# EAGLE design source_eagle (EAGLE 9.6.2)
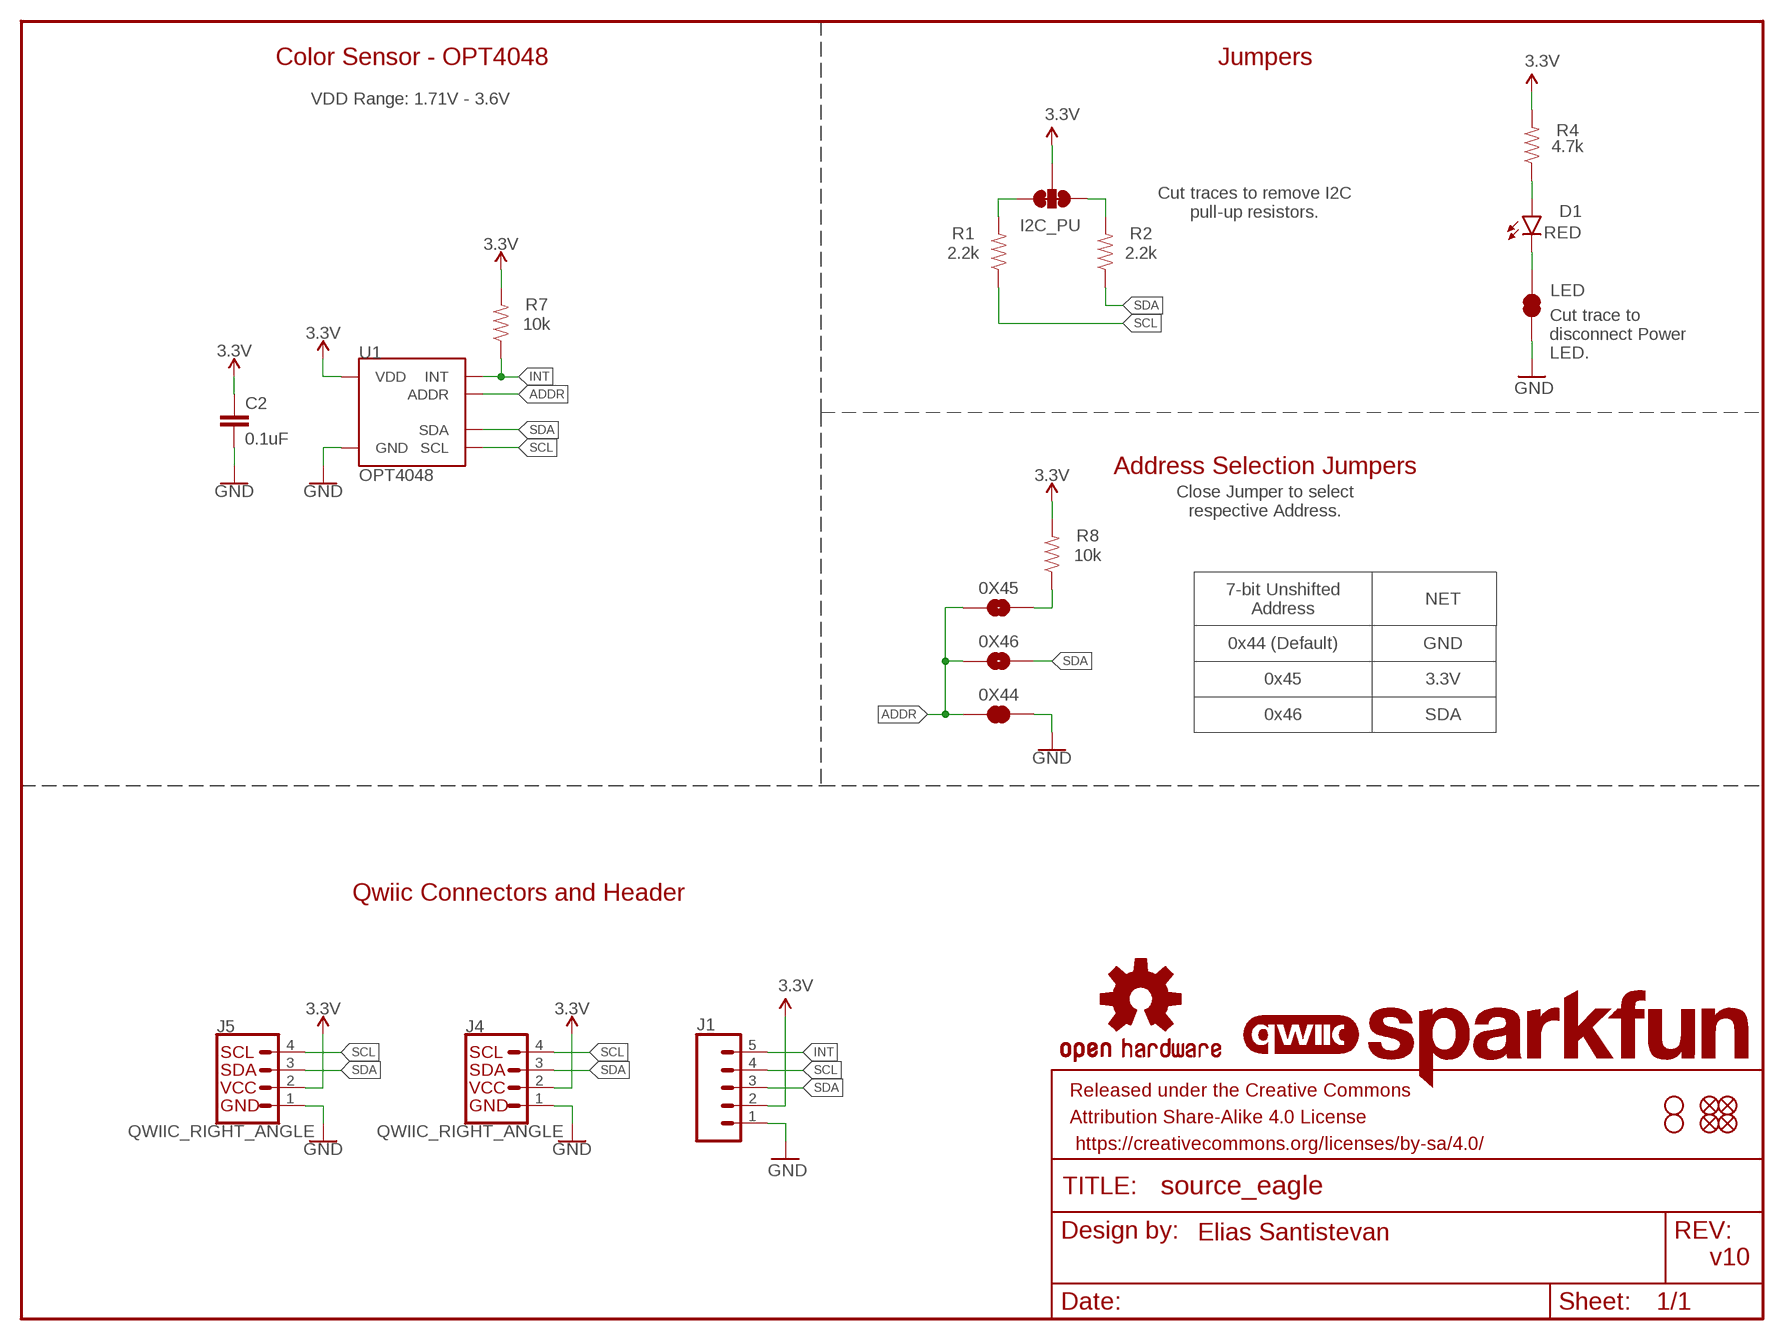
[diagram p0: schematic, sheet 1]

## Parts
0X44  JUMPER-SMT_2_NC_TRACE_SILK  [SMT-JUMPER_2_NC_TRACE_SILK]
0X45  JUMPER-SMT_2_NO_SILK  [SMT-JUMPER_2_NO_SILK]
0X46  JUMPER-SMT_2_NO_SILK  [SMT-JUMPER_2_NO_SILK]
C2  0.1uF  0.1UF-0402T-16V-10%  [0402-TIGHT]
D1  RED  LED-RED_0603-KB  [LED-0603]
FD5  FIDUCIALUFIDUCIAL  [FIDUCIAL-MICRO]
FD6  FIDUCIALUFIDUCIAL  [FIDUCIAL-MICRO]
FD7  FIDUCIALUFIDUCIAL  [FIDUCIAL-MICRO]
FD8  FIDUCIALUFIDUCIAL  [FIDUCIAL-MICRO]
FRAME2  FRAME-LETTER  [CREATIVE_COMMONS]
H7  STAND-OFFTIGHT  [STAND-OFF-TIGHT]
H8  STAND-OFFTIGHT  [STAND-OFF-TIGHT]
I2C_PU  S_MODE  JUMPER-SMT_3_2-NC_TRACE_SILK  [SMT-JUMPER_3_2-NC_TRACE_SILK]
J1  CONN_05NO_SILK  [1X05_NO_SILK]
J4  QWIIC_RIGHT_ANGLE  QWIIC_CONNECTORJS-1MM  [JST04_1MM_RA]
J5  QWIIC_RIGHT_ANGLE  QWIIC_CONNECTORJS-1MM  [JST04_1MM_RA]
LED  JUMPER-SMT_2_NC_TRACE_SILK  [SMT-JUMPER_2_NC_TRACE_SILK]
LOGO1  SFE_LOGO_NAMEBLANK  [BLANK]
LOGO2  QWIIC_LOGO_3MM  [QWIIC_3MM]
LOGO3  OSHW-LOGONO_SILK  [DUMMY]
R1  2.2k  2.2KOHM-0603-1/10W-1%  [0603]
R2  2.2k  2.2KOHM-0603-1/10W-1%  [0603]
R4  4.7k  4.7KOHM-0603-1/10W-1%  [0603]
R7  10k  10KOHM-0603-1/10W-1%  [0603]
R8  10k  10KOHM-0603-1/10W-1%  [0603]
U1  OPT4048  [FCSOT]

## Nets
3.3V: C2.1 I2C_PU.2 J1.2 J4.2 J5.2 R4.2 R7.2 R8.2 U1.P1(VDD)
ADDR: 0X44.1 0X45.1 0X46.1 U1.P2(ADDR)
GND: 0X44.2 C2.2 J1.1 J4.1 J5.1 LED.1 U1.P4(GND)
INT: J1.5 R7.1 U1.P7(INT)
N$1: I2C_PU.1 R1.2
N$2: I2C_PU.3 R2.2
N$3: D1.A R4.1
N$4: D1.C LED.2
N$9: 0X45.2 R8.1
SCL: J1.4 J4.4 J5.4 R1.1 U1.P5(SCL)
SDA: 0X46.2 J1.3 J4.3 J5.3 R2.1 U1.P8(SDA)

## Notes on the sheet
- Color Sensor - OPT4048 | Jumpers
- VDD Range: 1.71V - 3.6V
- Cut traces to remove I2C
  pull-up resistors.
- Cut trace to
  disconnect Power
  LED.
- Address Selection Jumpers
- Close Jumper to select
  respective Address.
- 7-bit Unshifted
  Address
- NET
- 0x44 (Default) | GND
- 0x45 | 3.3V
- 0x46 | SDA
- Qwiic Connectors and Header
- Elias Santistevan
- v10

## Library data of the parts
0X44 LED = SparkFun-Jumpers:JUMPER-SMT_2_NC_TRACE: Normally closed trace jumper This jumper has a trace between two pads so it's normally closed (NC). Use a razor knife to open the connection. For best results follow the IPC guidelines for cutting traces: Cutout at least 0.063 mm (0.005 in). Remove all loose material to clean up the cut area. Seal the cut with an approved epoxy. Reapply solder to reclose the connection.
0X45 0X46 = SparkFun-Jumpers:JUMPER-SMT_2_NO: Normally open jumper This jumper has two pads in close proximity to each other. Apply solder to close the connection. Round pads are easier to solder for beginners, but are a lot larger. SparkFun Product that uses the round pads: SparkFun EL Sequencer
C2 = SparkFun-Capacitors:0.1UF: 0.1µF ceramic capacitors A capacitor is a passive two-terminal electrical component used to store electrical energy temporarily in an electric field.; PROD_ID: CAP-12416
D1 = SparkFun-LED:LED-RED: Red SMD LED Used in manufacturing of most products at SparkFun Packages: 0603 - KB - KingBright (DIO-17976) SMD 0603 package [Datasheet] <https://www.kingbrightusa.com/images/catalog/SPEC/APT1608SURCK.pdf> 0603 - (DIO-00819, has gone EOL) SMD 0603 package 0603 SMART - SMD 0603 SMART package ( more efficient and expensive)[Product Link] <http://www.osram-os.com/Graphics/XPic2/00077099_0.pdf> 1206 - SMD1206 package [Product Link] <https://www.sparkfun.com/datasheets/DevTools/LilyPad/Q150OVS4.pdff> SparkFun Products: Pro Mini 328 -5V <https://www.sparkfun.com/products/821> RedBoard <https://www.sparkfun.com/products/12757> IOIO-OTG <https://www.sparkfun.com/products/13613>; PROD_ID: DIO-17976
FD5-FD8 = SparkFun-Aesthetics:FIDUCIAL: Fiducial Alignment Points Point-of-reference for pick-and-place machines and other optical instruments.
FRAME2 = SparkFun-Aesthetics:FRAME-LETTER: Schematic Frame - Letter Standard 8.5x11 US Letter frame
H7 H8 = SparkFun-Hardware:STAND-OFF: Stand Off Drill holes for mechanically mounting via screws, standoffs, etc. Note: Use the keepout ring to avoid running the screw head into surrounding components. Variant Overviews STAND-OFF - Mechanical footprint for a #4 phillips button head screw. STAND-OFF-TIGHT - Mechanical footprint for a #4 phillips button head screw, Example SparkFun Products Screw - Phillips Head (1/4", 4-40, 10 pack) (PRT-10453) Screw - Phillips Head (1/2", 4-40, 10 pack) (PRT-10452) Screw - Phillips Head (3/4", 4-40, 10 pack) (PRT-10451) Screw - Phillips Head (1", 4-40, 10 pack) (PRT-10450)
I2C_PU = SparkFun-Jumpers:JUMPER-SMT_3_2-NC_TRACE: Normally closed trace jumper (2 of 2 connections) This jumper has a trace between all three pads so they are normally closed (NC). Use a razor knife to open the connection(s). For best results follow the IPC guidelines for cutting traces: Cutout at least 0.063 mm (0.005 in). Remove all loose material to clean up the cut area. Seal the cut with an approved epoxy. Reapply solder to reclose the connection(s).
J1 = SparkFun-Connectors:CONN_05: Multi connection point. Often used as Generic Header-pin footprint for 0.1 inch spaced/style header connections On any of the 0.1 inch spaced packages, you can populate with these: Break Away Headers - Straight (PRT-00116) Break Away Male Headers - Right Angle (PRT-00553) Female Headers (PRT-00115) Break Away Headers - Machine Pin (PRT-00117) Break Away Female Headers - Swiss Machine Pin (PRT-00743) For SCREWTERMINALS and SPRING TERMINALS visit here: Screw Terimnals on SparkFun.com (5mm/3.5mm/2.54mm spacing) This device is also useful as a general connection point to wire up your design to another part of your project. Our various solder wires solder well into these plated through hole pads. Hook-Up Wire - Assortment (Stranded, 22 AWG) (PRT-11375) Hook-Up Wire - Assortment (Solid Core, 22 AWG) (PRT-11367) View the entire wire category on our website here Special notes: Molex polarized connector foot print use with SKU : PRT-08231 with associated crimp pins and housings. 1MM SMD Version SKU: PRT-10208
J4 J5 = SparkFun-Connectors:QWIIC_CONNECTOR: SparkFun I2C Standard Qwiic Connector An SMD 1mm pitch JST connector makes it easy and quick (get it? Qwiic?) to connect I2C devices to each other. The Qwiic system <http://www.sparkfun.com/qwiic> enables fast and solderless connection between popular platforms and various sensors and actuators. We carry 200mm <https://www.sparkfun.com/products/14204>, 100mm <https://www.sparkfun.com/products/14205>, 50mm <https://www.sparkfun.com/products/14206>, and breadboard friendly <https://www.sparkfun.com/products/14207> Qwiic cables. We also offer 10 pcs strips <https://www.sparkfun.com/products/14323> the SMD connectors.; PROD_ID: CONN-13694
LOGO1 = SparkFun-Aesthetics:SFE_LOGO_NAME: SparkFun Font Logo This is the SparkFun name logo. The logo on the schematic will always be the same size; the package variant is the height of the flame part of the logo (or the height the flame would be, if it were drawn). Default layer for the logo on the board is tSilk.
LOGO2 = SparkFun-Aesthetics:QWIIC_LOGO: Qwiic Logos for placement on schematic and PCB. The 5.5mm silk logo is best for placing next to Qwiic connector.
LOGO3 = SparkFun-Aesthetics:OSHW-LOGO: Open-Source Hardware (OSHW) Logo This logo indicates the piece of hardware it is found on incorporates a OSHW license and/or adheres to the definition of open source hardware found here: http://freedomdefined.org/OSHW
R1 R2 = SparkFun-Resistors:2.2KOHM: 2.2kΩ resistor A resistor is a passive two-terminal electrical component that implements electrical resistance as a circuit element. Resistors act to reduce current flow, and, at the same time, act to lower voltage levels within circuits. - Wikipedia; PROD_ID: RES-08272
R4 = SparkFun-Resistors:4.7KOHM: 4.7kΩ resistor A resistor is a passive two-terminal electrical component that implements electrical resistance as a circuit element. Resistors act to reduce current flow, and, at the same time, act to lower voltage levels within circuits. - Wikipedia; PROD_ID: RES-07857
R7 R8 = SparkFun-Resistors:10KOHM: 10kΩ resistor A resistor is a passive two-terminal electrical component that implements electrical resistance as a circuit element. Resistors act to reduce current flow, and, at the same time, act to lower voltage levels within circuits. - Wikipedia; PROD_ID: RES-00824
U1 = Color_Sensor:OPT4048: Texas Instruments - OPT4048 Tristiumulus XYZ Color Sensor The OPT4048 is a single-chip high resolution color sensor, capable of measuring four channels each with specific engineered spectral responses. Three of the four channels closely match the CIE tristimulus spectra with the fourth channel having a wide band spectral response. With measurements from these channels, important characteristics of the lighting environment can be extracted like (i) light intensity (lux), (ii) color in CIE XY, LUV coordinates and (iii) Correlated Color Temperature. The OPT4048 is available in a small SOT-5X3 package.; PROD_ID: IC-18868

## Board
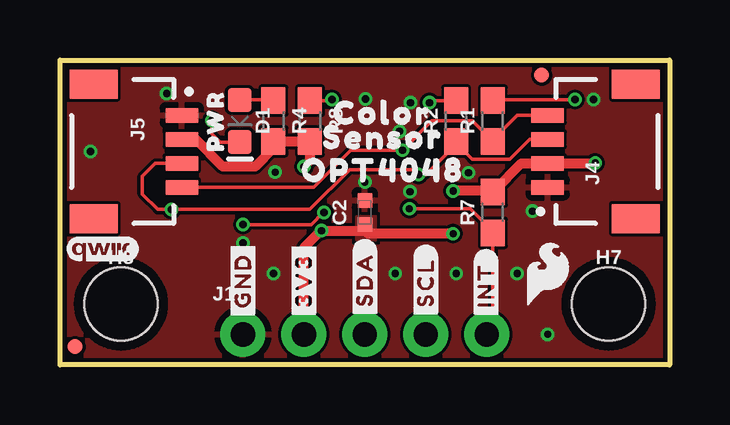
[diagram p1: board, top side]
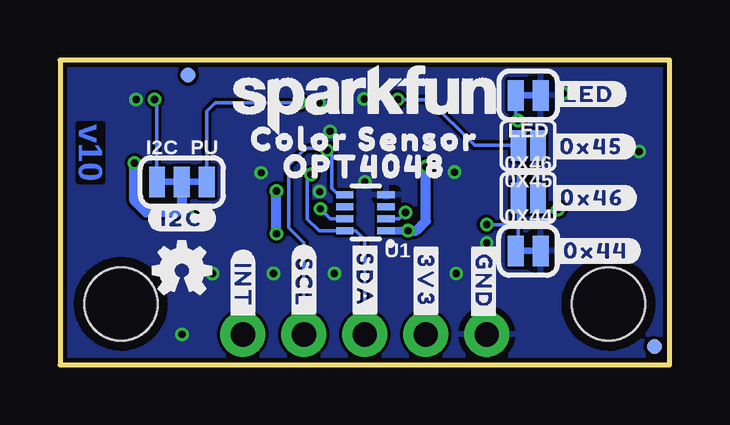
[diagram p2: board, bottom side, seen from below]

Size 25.4 x 12.7 mm. Coordinates in mm from the lower left corner, seen from the top.
Outline: 0,0 0,12.7 25.4,12.7 25.4,0 0,0
Copper layers (1*16): Top 0.035mm / dielectric 1.5mm / Bottom 0.035mm
Design rules "SparkFun-2-Layer-Minimum-JLCPCB": minimum track width 5mil, minimum drill 0.3mm, track to track 5mil, track to pad 5mil, pad to pad 5mil, via to via 5mil, smd to smd 5mil, copper to edge 7mil, drill to drill 7mil, minimum pad ring 5mil, minimum via ring 5mil, stop-mask expansion 2.5mil, vias tented up to drill 25mil, thermal gap 10mil

### Footprints (pad centres in the part's own frame; a part is rotated, then mirrored left to right if it is on the bottom)
SMT-JUMPER_2_NC_TRACE_SILK = smd 0.66 x 1.27: 1 -0.521,0; 2 0.521,0
SMT-JUMPER_2_NO_SILK = smd 0.635 x 1.27: 1 -0.406,0; 2 0.406,0
0402-TIGHT = smd 0.6 x 0.6: 1 -0.5,0; 2 0.5,0
LED-0603 = smd 1 x 1: A -0.877,0; C 0.877,0
FIDUCIAL-MICRO = smd 0.635 x 0.635: 1 0,0
STAND-OFF-TIGHT = hole 3.048: 0,0
SMT-JUMPER_3_2-NC_TRACE_SILK = smd 0.66 x 1.27: 1 -1.041,0; 2 0,0; 3 1.041,0
1X05_NO_SILK = drill 1.016 pad 1.88: 1 0,0; 2 2.54,0; 3 5.08,0; 4 7.62,0; 5 10.16,0
JST04_1MM_RA = smd 0.6 x 1.35: 1 -1.5,0; 2 -0.5,0; 3 0.5,0; 4 1.5,0 | smd 1.2 x 2: NC1 2.8,-3.675; NC2 -2.8,-3.675
0603 = smd 1.1 x 1: 1 -0.85,0; 2 0.85,0
FCSOT = smd 0.72 x 0.3: P1 -0.889,0.762; P2 -0.889,0.262; P3 -0.889,-0.238; P4 -0.889,-0.738; P5 0.831,-0.738; P6 0.831,-0.238; P7 0.831,0.262; P8 0.831,0.762

### Placement (x,y rotation side)
0X44  5.89,4.75 0 bottom
0X45  5.89,9.14 180 bottom
0X46  5.89,6.96 0 bottom
C2  12.7,6.35 90 top
D1  7.49,10.16 270 top
FD5  20.07,12.06 0 bottom
FD6  0.64,0.76 0 bottom
FD7  0.64,0.76 0 top
FD8  20.07,12.06 0 top
FRAME2  not placed on the board
H7  22.86,2.54 0 top
H8  2.54,2.54 0 top
I2C_PU  20.32,7.62 0 bottom
J1  7.62,1.27 0 top
J4  20.32,8.89 90 top
J5  5.08,8.89 270 top
LED  5.89,11.23 180 bottom
LOGO1  not placed on the board
LOGO2  1.78,4.83 0 top
LOGO3  not placed on the board
LOGO4  SPECIAL_INSTRUCTIONS-ORDERING  [ORDERING_INSTRUCTIONS]  not placed on the board
R1  18.03,10.16 90 top
R2  16.51,10.16 90 top
R4  8.89,10.16 270 top
R7  18.03,6.35 90 top
R8  10.41,10.16 270 top
U1  12.7,6.35 180 bottom
U$1  [#INT#9]  17.75,3.33 90 top
U$2  [COLOR_SENSOR227]  12.7,9.4 0 bottom
U$3  [OPT4048229]  12.7,8.26 0 bottom
U$4  [#0X44#11]  3.07,4.75 0 bottom
U$5  [#0X46#11]  3.23,6.96 0 bottom
U$6  [#0X45#11]  3.25,9.09 0 bottom
U$7  [#INT#3]  17.78,3.3 270 bottom
U$8  [SFE_LOGO_NAME_.1]  12.7,11.05 0 bottom
U$9  [COLOR14]  13.44,10.49 0 top
U$10  [#3V3#0]  10.16,3.51 270 bottom
U$11  [SENSOR15]  13.46,9.47 0 top
U$12  [OPT4048229]  13.46,8.1 0 top
U$13  [#SDA#1]  12.7,3.53 270 bottom
U$14  [#LED#11]  3.38,11.28 0 bottom
U$15  [OSHW-LOGO-MINI]  20.32,3.94 0 bottom
U$16  [#GND#4]  7.75,3.48 270 bottom
U$19  [#SCL#5]  15.24,3.43 270 bottom
U$20  [#I2C#11]  20.32,6.1 0 bottom
U$35  [SFE_LOGO_FLAME_.1]  20.32,3.81 0 top
U$37  [#3V3#0]  10.16,3.51 90 top
U$38  [#GND#4]  7.62,3.51 90 top
U$39  [#SCL#5]  15.24,3.43 90 top
U$40  [#SDA#6]  12.7,3.56 90 top
U$43  [PWR8821882023]  6.48,10.16 90 top

### Tracks (layer width: path | path; a pad name or v marks a point on that pad's centre or on a via)
3.3V  (via drill 0.3)
  Top 0.406: J1.2 10.16,4.88 10.87,5.59 v10.9,5.59 12.84,5.59 12.84,5.46 v16.38,5.46 | R7.2 18.12,7.28 | 18.12,7.28 19.22,8.39 J4.2 22.28,8.39 v22.3,8.41 | v16.38,7.24 16.43,7.28 18.12,7.28 | v10.16,8.26 10.41,8.51 R8.2 R4.2 8.89,9.02 8.13,8.26 6.78,8.26 5.65,9.39 J5.2
  Bottom 0.305: U1.P1 v10.9,5.59
  Bottom 0.406: v16.38,5.46 v16.38,7.24 | I2C_PU.2 20.32,6.58 20.55,6.35 21.82,6.35 22.3,6.83 v22.3,8.41 | v10.9,5.59 10.57,5.59 10.16,5.99 v10.16,8.26
  pour Top (no thermals): 12.34,6.1 12.34,5.21 13.16,5.21 13.16,6.17 12.34,6.17 12.34,6.12
ADDR  (via drill 0.3)
  Top 0.152: v11,6.35 10.97,6.35 10.46,5.84 v7.62,5.84
  Bottom 0.152: U1.P2 11.26,6.09 v11,6.35 | 0X44.1 6.3,4.86 6.3,5.82 | 6.3,5.82 0X46.1 6.3,7.87 6.12,8.05 5.9,8.05 5.49,8.46 0X45.1 | v7.62,5.84 6.33,5.84 6.3,5.82
GND  (via drill 0.3)
  other vias: 13.97,3.81 8.89,3.81 7.62,5.08 14.61,10.92 22.23,11.05 17.02,8 14.58,7.21 14.15,9.73 1.27,8.89 20.32,1.27 12.73,11.07 16.51,3.81 19.05,3.81 12.7,7.62 4.45,11.3 19.68,6.4 8.97,8.03
  pour Top (rank 4): 0,12.7 25.4,12.7 25.4,0 0,0
  pour Bottom (rank 4): 0,12.7 25.4,12.7 25.4,0 0,0
INT  (via drill 0.3)
  Top 0.152: v14.55,6.5 17.09,6.5 18.03,5.56 R7.1 18.03,1.52 J1.5
  Bottom 0.152: U1.P7 14.14,6.09 v14.55,6.5
N$1  (via drill 0.3)
  Top 0.152: v21.46,11.05 18.07,11.05 R1.2
  Bottom 0.152: I2C_PU.1 21.36,10.95 v21.46,11.05
N$2  (via drill 0.3)
  Top 0.152: v15.39,10.92 15.48,11.01 R2.2
  Bottom 0.152: I2C_PU.3 19.28,10.57 18.92,10.92 v15.39,10.92
N$3
  Top 0.152: D1.A 8.89,11.04
  Top 0.406: 8.89,11.04 R4.1
N$4  (via drill 0.3)
  Top 0.152: v6.33,10.19 6.33,9.63 6.67,9.28 D1.C
  Bottom 0.152: LED.2 6.41,10.27 v6.33,10.19
N$9  (via drill 0.3)
  Top 0.152: v11.33,11.05 11.29,11.01 R8.1
  Bottom 0.152: v11.33,11.05 10.03,11.05 8.13,9.14 0X45.2
SCL  (via drill 0.3)
  Top 0.152: J4.4 19.05,10.39 18.82,10.16 18.03,9.37 R1.1 17.2,10.15 17.2,10.16 15.49,10.16 v14.28,8.94 12.12,8.94 10.56,7.39 J5.4
  Bottom 0.152: U1.P5 13.55,7.11 13.82,7.11 14.07,7.37 14.07,8.74 v14.28,8.94 14.35,9.02 15.16,9.02 15.88,8.31 15.88,5.71 15.24,5.08 J1.4
SDA  (via drill 0.3)
  Top 0.152: J4.3 19.58,9.39 18.75,8.56 17.17,8.56 16.51,9.22 R2.1 16.51,9.19 15.24,7.92 v14.94,7.92 14.73,8.13 12.06,8.13 10.41,6.48 v4.65,6.48 4.06,6.48 3.43,7.11 3.43,7.85 3.97,8.39 J5.3
  Bottom 0.152: v14.94,7.92 15.09,7.77 15.09,6.07 14.61,5.59 U1.P8 13.08,5.59 12.7,5.21 J1.3 | 0X46.2 5.49,6.55 5.33,6.4 4.72,6.4 v4.65,6.48

### Text on the board
Bottom: v10
Measures: Units in Inches
tDocu: 1.6mm Thickness / 1 oz. Copper / Lead-Free HASL finish / Material: TG135-140 / Red Soldermask / White Silkscreen | Elias Santistevan